# Altium project Mach_dieu_khien_V2.PrjPcb
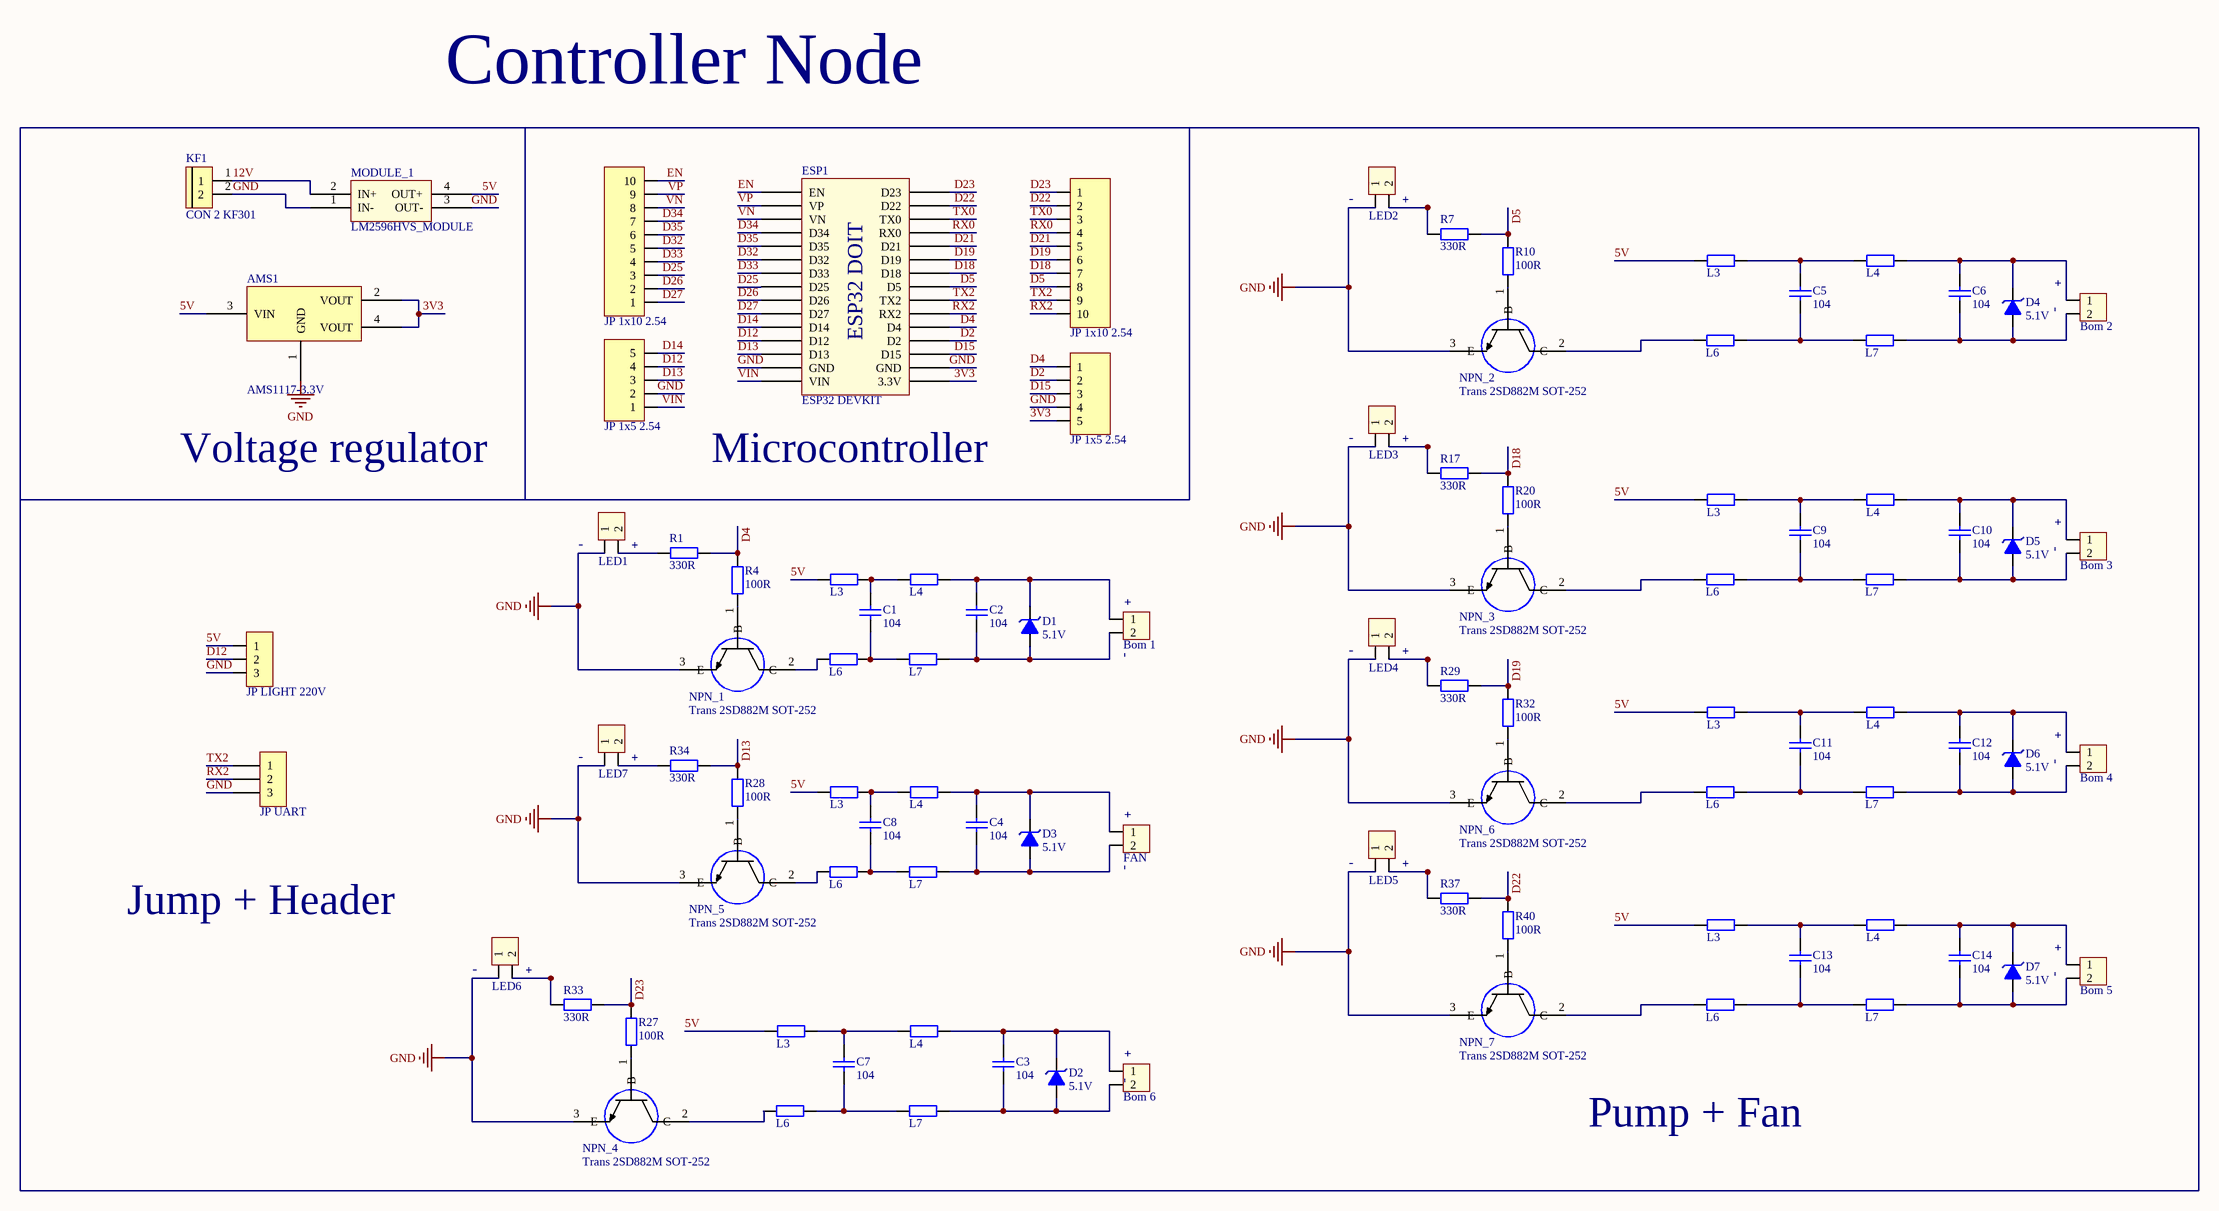
[diagram p0: Mach_sche.SchDoc]
1 sheet, 94 parts. Net scope: global (net labels, ports and power ports of the same name join across sheets).
Board file: Mach_dk.PcbDoc

## Sheet Mach_sche.SchDoc
size 420 x 500 mm; SheetNumber: 1; SheetTotal: 1

### Parts
AMS1  AMS1117-3.3V  [SOT223]
C1  104  [tu 1206]
C2  104  [tu 1206]
C3  104  [tu 1206]
C4  104  [tu 1206]
C5  104  [tu 1206]
C6  104  [tu 1206]
C7  104  [tu 1206]
C8  104  [tu 1206]
C9  104  [tu 1206]
C10  104  [tu 1206]
C11  104  [tu 1206]
C12  104  [tu 1206]
C13  104  [tu 1206]
C14  104  [tu 1206]
D1  5.1V  [DIODE ZENNER SMD SOD80]
D2  5.1V  [DIODE ZENNER SMD SOD80]
D3  5.1V  [DIODE ZENNER SMD SOD80]
D4  5.1V  [DIODE ZENNER SMD SOD80]
D5  5.1V  [DIODE ZENNER SMD SOD80]
D6  5.1V  [DIODE ZENNER SMD SOD80]
D7  5.1V  [DIODE ZENNER SMD SOD80]
ESP1  ESP32 DEVKIT  [ESP32 WROOM 32 KIT]
H1  JP UART  [Header 3P DC 2.54]
H2  LED1  [XH2.54M-2]
H3  Bom 1  [Header 2P DC 2.54]
H4  Bom 6  [Header 2P DC 2.54]
H5  FAN  [Header 2P DC 2.54]
H6  LED2  [XH2.54M-2]
H7  Bom 2  [Header 2P DC 2.54]
H8  LED3  [XH2.54M-2]
H9  Bom 3  [Header 2P DC 2.54]
H10  LED4  [XH2.54M-2]
H11  Bom 4  [Header 2P DC 2.54]
H12  LED6  [XH2.54M-2]
H13  LED7  [XH2.54M-2]
H14  LED5  [XH2.54M-2]
H15  Bom 5  [Header 2P DC 2.54]
JP1  JP 1x10 2.54  [JP 1x10 DT]
JP3  JP 1x10 2.54  [JP 1x10 DT]
JP4  JP 1x5 2.54  [JP 1x5 DT]
JP5  JP 1x5 2.54  [JP 1x5 DT]
JP6  JP LIGHT 220V  [JP 1x3 DT]
KF1  CON 2 KF301  [Con 2 KF301 5.08]
MODULE_1  LM2596HVS_MODULE  [LM2596HVS_MODULE]
NPN_1  Trans 2SD882M SOT-252  [Trans_2SD882_DIP]
NPN_2  Trans 2SD882M SOT-252  [Trans_2SD882_DIP]
NPN_3  Trans 2SD882M SOT-252  [Trans_2SD882_DIP]
NPN_4  Trans 2SD882M SOT-252  [Trans_2SD882_DIP]
NPN_5  Trans 2SD882M SOT-252  [Trans_2SD882_DIP]
NPN_6  Trans 2SD882M SOT-252  [Trans_2SD882_DIP]
NPN_7  Trans 2SD882M SOT-252  [Trans_2SD882_DIP]
R1  330R  [Tro SMD 0805]
R2  L3  [tro smd 1206]
R3  L4  [tro smd 1206]
R4  100R  [tro smd 1206]
R5  L6  [tro smd 1206]
R6  L7  [tro smd 1206]
R7  330R  [Tro SMD 0805]
R8  L3  [tro smd 1206]
R9  L4  [tro smd 1206]
R10  100R  [tro smd 1206]
R11  L6  [tro smd 1206]
R12  L7  [tro smd 1206]
R13  L4  [tro smd 1206]
R14  L7  [tro smd 1206]
R15  L4  [tro smd 1206]
R16  L7  [tro smd 1206]
R17  330R  [Tro SMD 0805]
R18  L3  [tro smd 1206]
R19  L4  [tro smd 1206]
R20  100R  [tro smd 1206]
R21  L3  [tro smd 1206]
R22  L6  [tro smd 1206]
R23  L3  [tro smd 1206]
R24  L6  [tro smd 1206]
R25  L6  [tro smd 1206]
R26  L7  [tro smd 1206]
R27  100R  [tro smd 1206]
R28  100R  [tro smd 1206]
R29  330R  [Tro SMD 0805]
R30  L3  [tro smd 1206]
R31  L4  [tro smd 1206]
R32  100R  [tro smd 1206]
R33  330R  [Tro SMD 0805]
R34  330R  [Tro SMD 0805]
R35  L6  [tro smd 1206]
R36  L7  [tro smd 1206]
R37  330R  [Tro SMD 0805]
R38  L3  [tro smd 1206]
R39  L4  [tro smd 1206]
R40  100R  [tro smd 1206]
R41  L6  [tro smd 1206]
R42  L7  [tro smd 1206]

### Nets
GND: AMS1.1(GND) ESP1.14(GND) ESP1.17(GND) H1.3 H2.1 H6.1 H8.1 H10.1 H12.1 H13.1 H14.1 JP4.4 JP5.2 JP6.3 KF1.2 MODULE_1.1(IN-) MODULE_1.3(OUT-) NPN_1.3(E) NPN_2.3(E) NPN_3.3(E) NPN_4.3(E) NPN_5.3(E) NPN_6.3(E) NPN_7.3(E)
3V3: AMS1.2(VOUT) AMS1.4(VOUT) ESP1.16(3.3V) JP4.5
5V: AMS1.3(VIN) JP6.1 MODULE_1.4(OUT+) R2.1 R8.1 R18.1 R21.1 R23.1 R30.1 R38.1
12V: KF1.1 MODULE_1.2(IN+)
D2: ESP1.19(D2) JP4.2
D4: ESP1.20(D4) JP4.1 R1.2 R4.1
D5: ESP1.23(D5) JP3.8 R7.2 R10.1
D12: ESP1.12(D12) JP5.4 JP6.2
D13: ESP1.13(D13) JP5.3 R28.1 R34.2
D14: ESP1.11(D14) JP5.5
D15: ESP1.18(D15) JP4.3
D18: ESP1.24(D18) JP3.7 R17.2 R20.1
D19: ESP1.25(D19) JP3.6 R29.2 R32.1
D21: ESP1.26(D21) JP3.5
D22: ESP1.29(D22) JP3.2 R37.2 R40.1
D23: ESP1.30(D23) JP3.1 R27.1 R33.2
D25: ESP1.8(D25) JP1.3
D26: ESP1.9(D26) JP1.2
D27: ESP1.10(D27) JP1.1
D32: ESP1.6(D32) JP1.5
D33: ESP1.7(D33) JP1.4
D34: ESP1.4(D34) JP1.7
D35: ESP1.5(D35) JP1.6
EN: ESP1.1(EN) JP1.10
RX0: ESP1.27(RX0) JP3.4
RX2: ESP1.21(RX2) H1.2 JP3.10
TX0: ESP1.28(TX0) JP3.3
TX2: ESP1.22(TX2) H1.1 JP3.9
VIN: ESP1.15(VIN) JP5.1
VN: ESP1.3(VN) JP1.8
VP: ESP1.2(VP) JP1.9
NetC1_1: C1.1 R2.2 R3.1
NetC1_2: C1.2 R5.2 R6.1
NetC2_1: C2.1 D1.2(K) H3.1 R3.2
NetC2_2: C2.2 D1.1(A) H3.2 R6.2
NetC3_1: C3.1 D2.2(K) H4.1 R13.2
NetC3_2: C3.2 D2.1(A) H4.2 R14.2
NetC4_1: C4.1 D3.2(K) H5.1 R15.2
NetC4_2: C4.2 D3.1(A) H5.2 R16.2
NetC5_1: C5.1 R8.2 R9.1
NetC5_2: C5.2 R11.2 R12.1
NetC6_1: C6.1 D4.2(K) H7.1 R9.2
NetC6_2: C6.2 D4.1(A) H7.2 R12.2
NetC7_1: C7.1 R13.1 R21.2
NetC7_2: C7.2 R14.1 R22.2
NetC8_1: C8.1 R15.1 R23.2
NetC8_2: C8.2 R16.1 R24.2
NetC9_1: C9.1 R18.2 R19.1
NetC9_2: C9.2 R25.2 R26.1
NetC10_1: C10.1 D5.2(K) H9.1 R19.2
NetC10_2: C10.2 D5.1(A) H9.2 R26.2
NetC11_1: C11.1 R30.2 R31.1
NetC11_2: C11.2 R35.2 R36.1
NetC12_1: C12.1 D6.2(K) H11.1 R31.2
NetC12_2: C12.2 D6.1(A) H11.2 R36.2
NetC13_1: C13.1 R38.2 R39.1
NetC13_2: C13.2 R41.2 R42.1
NetC14_1: C14.1 D7.2(K) H15.1 R39.2
NetC14_2: C14.2 D7.1(A) H15.2 R42.2
NetH2_2: H2.2 R1.1
NetH6_2: H6.2 R7.1
NetH8_2: H8.2 R17.1
NetH10_2: H10.2 R29.1
NetH12_2: H12.2 R33.1
NetH13_2: H13.2 R34.1
NetH14_2: H14.2 R37.1
NetNPN_1_1: NPN_1.1(B) R4.2
NetNPN_1_2: NPN_1.2(C) R5.1
NetNPN_2_1: NPN_2.1(B) R10.2
NetNPN_2_2: NPN_2.2(C) R11.1
NetNPN_3_1: NPN_3.1(B) R20.2
NetNPN_3_2: NPN_3.2(C) R25.1
NetNPN_4_1: NPN_4.1(B) R27.2
NetNPN_4_2: NPN_4.2(C) R22.1
NetNPN_5_1: NPN_5.1(B) R28.2
NetNPN_5_2: NPN_5.2(C) R24.1
NetNPN_6_1: NPN_6.1(B) R32.2
NetNPN_6_2: NPN_6.2(C) R35.1
NetNPN_7_1: NPN_7.1(B) R40.2
NetNPN_7_2: NPN_7.2(C) R41.1

### Notes on the sheet
- Controller Node
- (near H6) -
- (near H6) +
- (near H7) +
- (near H7) -
- (near H8) -
- (near H8) +
- Voltage regulator
- Microcontroller
- (near H9) +
- (near H2) -
- (near H2) +
- (near H9) -
- (near H3) +
- (near H3) -
- (near H10) -
- (near H10) +
- (near H13) -
- (near H13) +
- (near H11) +
- (near H11) -
- (near H5) +
- Jump + Header
- (near H5) -
- (near H14) -
- (near H14) +
- (near H12) -
- (near H12) +
- (near H15) +
- (near H15) -
- (near H4) +
- (near H4) -
- Pump + Fan
- (in symbol ESP32 WROOM 32 KIT) ESP32 DOIT

### Library data of the parts
AMS1 = AMS1117 SMD: Dán; Value: AMS1117-3.3V SOT223; Don_Vi: Con; Ma_Hang: MH000596; Ghi_Chu: *; Kieu_Chan: *; Chung_Loai: Dán
C1-C14 = Tu 1206 104 50V 20%: Dán; Don_Vi: Con; So_Chan: 2; Ten_Linh_Kien: Tụ 1206 104-0.1uF 20% 50V; Ma_Hang: MH004544; Chung_Loai: Dán; Kieu_Chan: *
D1-D7 = Diode Zener 12V: Dán; Ma_Hang: MH000945; Don_Vi: Con; Ten_Linh_Kien: Diode Zener 1/2W 12V SMD1206 ZMM12; Kieu_Chan: *; Ghi_Chu: *; Chung_Loai: Dán
ESP1 = ESP32 WROOM 32 KIT
H1 = Header 3P 2.54 Duc Cong: Cắm; Ten_Linh_Kien: Header 3P XH2.54-3P Đực Cong; Don_Vi: Con; Ma_Hang: MH001302; Chung_Loai: Cắm
H2 H6 H8 H10 H12-H14 = Header 2P 2.54 Duc Thang: Cắm; Ten_Linh_Kien: Header 2P XH2.54-2P Đực Thẳng; Don_Vi: Con; Ma_Hang: MH001283; Chung_Loai: Cắm
H3-H5 H7 H9 H11 H15 = Header 2P 2.54 Duc Cong: Cắm; Ten_Linh_Kien: Header 2P XH2.54-2P Đực Cong; Don_Vi: Con; Ma_Hang: MH002852; Chung_Loai: Cắm
JP1 JP3 = JP 1x10 2.54 Duc Thang: Cắm; Ten_Linh_Kien: Jump Đơn Đực 2.54MM 1x40P Thẳng 11MM; Don_Vi: Con; Ma_Hang: MH000903; Ghi_Chu: *; Kieu_Chan: *; Chung_Loai: Cắm
JP4 JP5 = JP 1x5 2.54 Duc Thang: Cắm; Ten_Linh_Kien: Jump Đơn Đực 2.54MM 1x40P Thẳng 11MM; Don_Vi: Con; Ma_Hang: MH000903; Ghi_Chu: *; Kieu_Chan: *; Chung_Loai: Cắm
JP6 = JP 1x3 2.54 Duc Thang: Cắm; Ten_Linh_Kien: Jump Đơn Đực 2.54MM 1x40P Thẳng 11MM; Don_Vi: Con; Ma_Hang: MH000903; Ghi_Chu: *; Kieu_Chan: *; Chung_Loai: Cắm
KF1 = CON 2 KF301: Cắm; Ma_Hang: MH000987; Ten_Linh_Kien: CON 2 KF301-2P 5.08MM Xanh Dương; Chung_Loai: Cắm; Ghi_Chu: *; Kieu_Chan: *; Don_Vi: Con
R1 R7 R17 R29 R33 R34 R37 = Tro 0805 5% 330R: Dán; Don_Vi: Con; So_Chan: 2; Ten_Linh_Kien: Trở 0805 5% 330R; Ma_Hang: MH005337; Chung_Loai: Dán; Kieu_Chan: *
R2 R3 R5 R6 R8 R9 R11-R16 R18 R19 R21-R26 R30 R31 R35 R36 R38 R39 R41 R42 = Tro 1206 1% 200R: Dán; So_Chan: 2; Don_Vi: Con; Ten_Linh_Kien: Trở 1206 1% 200R; Ma_Hang: MH005895; Chung_Loai: Dán; Kieu_Chan: *
R4 R10 R20 R27 R28 R32 R40 = Tro 1206 1% 100R: Dán; So_Chan: 2; Don_Vi: Con; Ten_Linh_Kien: Trở 1206 1% 100R; Ma_Hang: MH005891; Chung_Loai: Dán; Kieu_Chan: *